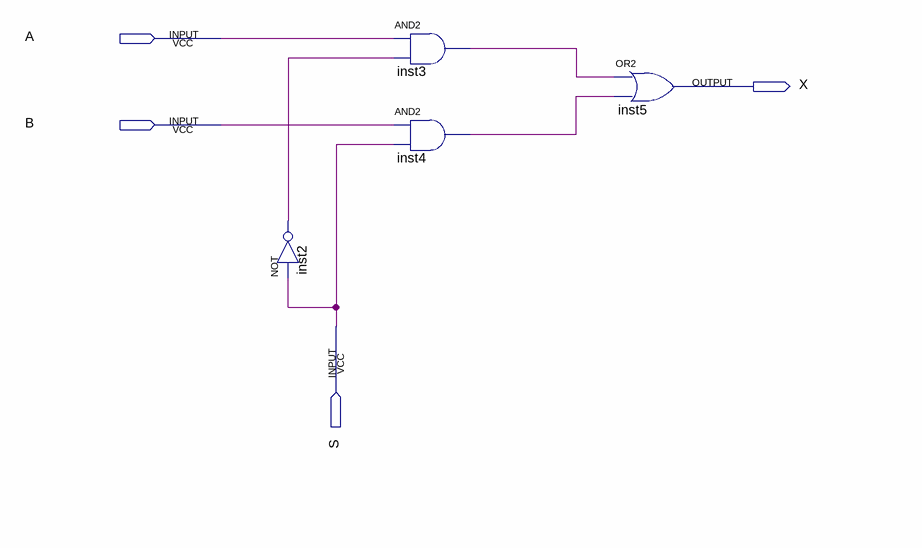
[diagram p0: schematic sheet]
// Quartus schematic MUX2_1.bdf as structural Verilog: 4 symbols, 4 pins
module MUX2_1 (
  input  A,
  input  B,
  input  S,
  output X
);

  wire inst2_out, inst3_out, inst4_out;

  not inst2 (inst2_out, S);
  and inst3 (inst3_out, A, inst2_out);
  and inst4 (inst4_out, B, S);
  or inst5 (X, inst3_out, inst4_out);
endmodule
